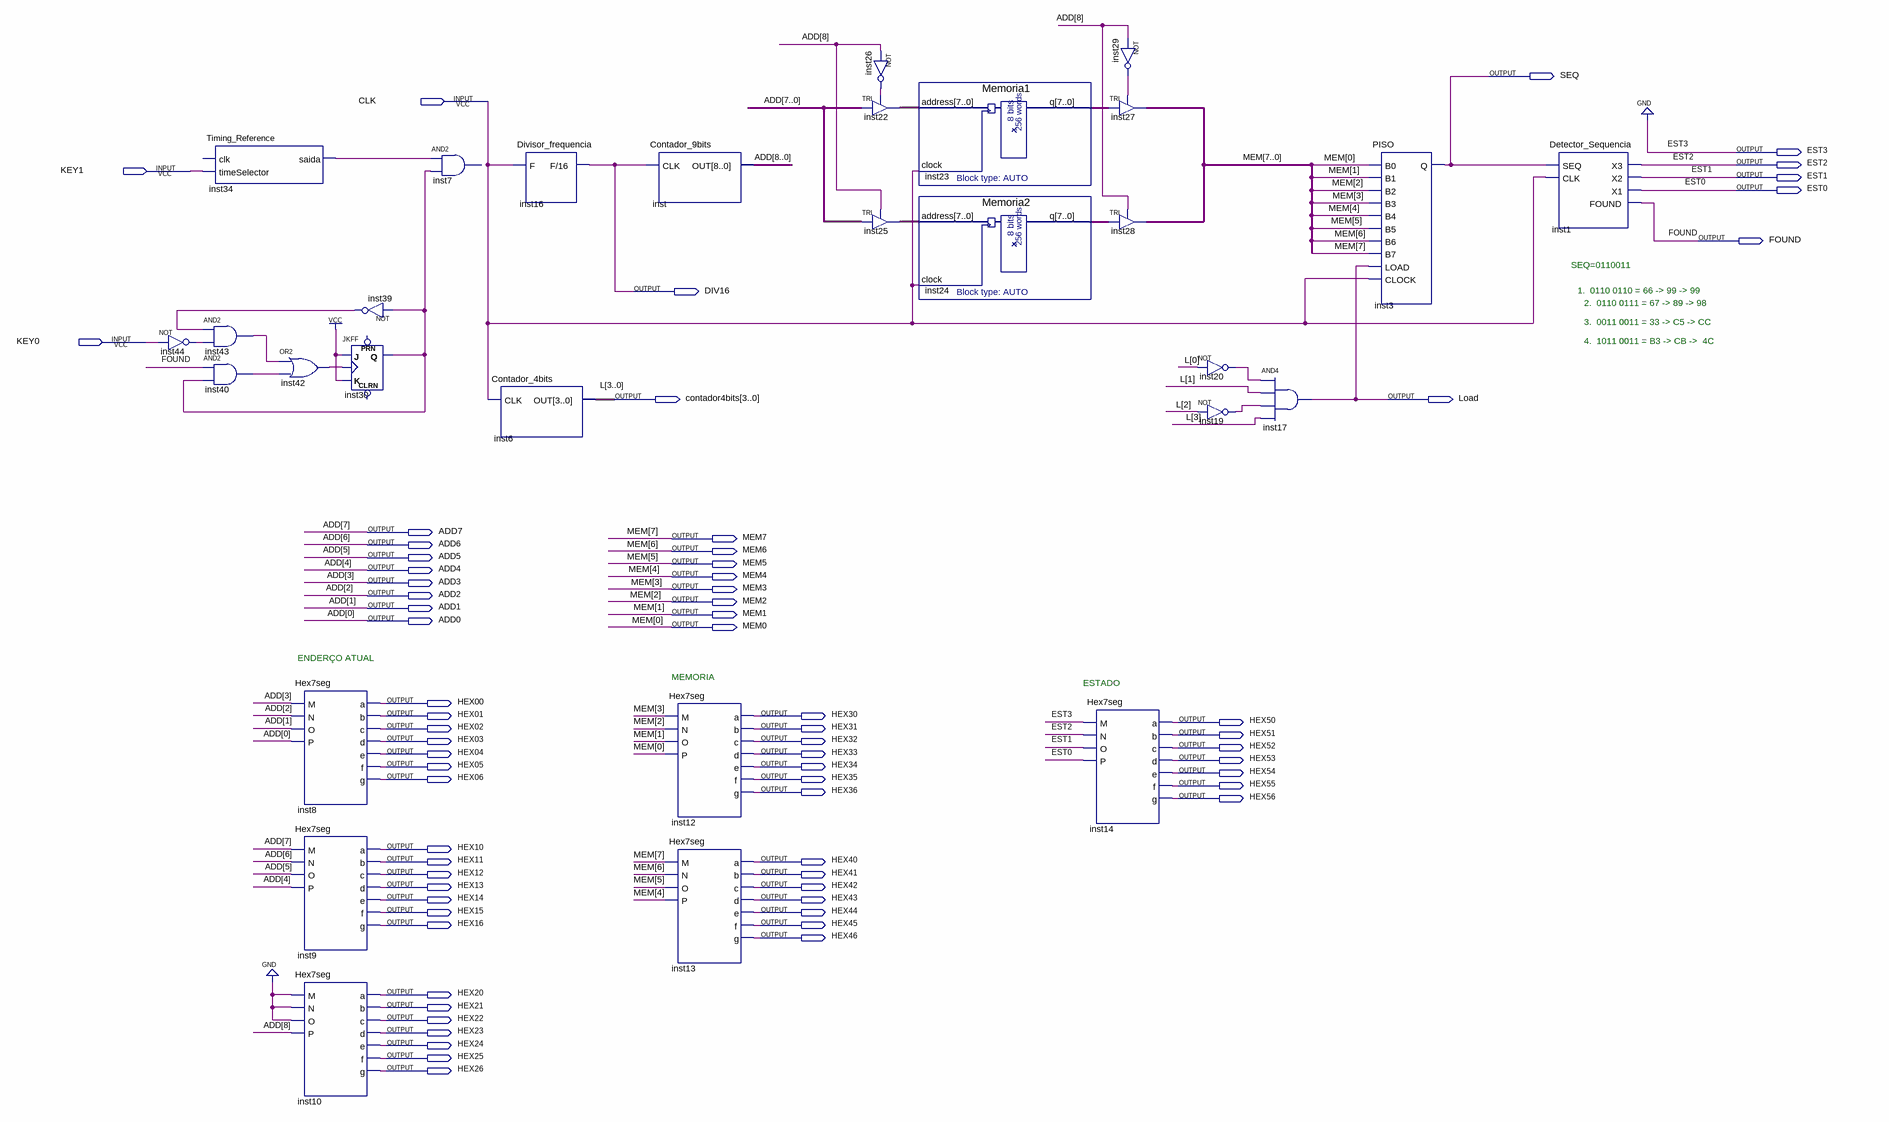
[diagram p0: schematic sheet]
// Quartus schematic Lab7.bdf as structural Verilog: 30 symbols, 70 pins
module Lab7 (
  input  CLK,
  input  KEY1,
  input  KEY0,
  output SEQ,
  output EST3,
  output EST2,
  output EST1,
  output EST0,
  output FOUND,
  output DIV16,
  output [3:0] contador4bits,
  output Load,
  output ADD7,
  output MEM7,
  output ADD6,
  output MEM6,
  output ADD5,
  output MEM5,
  output ADD4,
  output MEM4,
  output ADD3,
  output MEM3,
  output ADD2,
  output MEM2,
  output ADD1,
  output MEM1,
  output ADD0,
  output MEM0,
  output HEX00,
  output HEX01,
  output HEX30,
  output HEX50,
  output HEX02,
  output HEX31,
  output HEX51,
  output HEX03,
  output HEX32,
  output HEX52,
  output HEX04,
  output HEX33,
  output HEX53,
  output HEX05,
  output HEX34,
  output HEX54,
  output HEX06,
  output HEX35,
  output HEX55,
  output HEX36,
  output HEX56,
  output HEX10,
  output HEX11,
  output HEX40,
  output HEX12,
  output HEX41,
  output HEX13,
  output HEX42,
  output HEX14,
  output HEX43,
  output HEX15,
  output HEX44,
  output HEX16,
  output HEX45,
  output HEX46,
  output HEX20,
  output HEX21,
  output HEX22,
  output HEX23,
  output HEX24,
  output HEX25,
  output HEX26
);

  wire inst19_out, inst20_out, inst26_out, inst29_out, inst30_q, inst34_saida, inst39_out, inst40_out,
       inst42_out, inst43_out, inst44_out;
  wire [7:0] inst22_out, inst23_q, inst24_q, inst25_out;
  wire [8:8] ADD;

  not inst44 (inst44_out, KEY0);
  Timing_Reference inst34 (.timeSelector(KEY1), .saida(inst34_saida));  // open: clk
  and inst43 (inst43_out, inst39_out, inst44_out);
  and inst40 (inst40_out, FOUND, inst30_q);
  or inst42 (inst42_out, inst43_out, inst40_out);
  Hex7seg inst8 (
    .M(ADD3), .N(ADD2), .O(ADD1), .P(ADD0), .a(HEX00), .b(HEX01), .c(HEX02), .d(HEX03), .e(HEX04), .f(HEX05),
    .g(HEX06));
  Hex7seg inst9 (
    .M(ADD7), .N(ADD6), .O(ADD5), .P(ADD4), .a(HEX10), .b(HEX11), .c(HEX12), .d(HEX13), .e(HEX14), .f(HEX15),
    .g(HEX16));
  Hex7seg inst10 (
    .M(1'b0), .N(1'b0), .O(1'b0), .P(ADD[8]), .a(HEX20), .b(HEX21), .c(HEX22), .d(HEX23), .e(HEX24),
    .f(HEX25), .g(HEX26));
  JKFF inst30 (.K(1'b1), .J(1'b1), .CLK(inst42_out), .Q(inst30_q));  // open: PRN, CLRN
  not inst39 (inst39_out, inst30_q);
  // AND2 inst7 has open pins: IN1=inst34_saida, IN2=inst30_q, OUT=open
  Contador_4bits inst6 (.CLK(CLK), .OUT(contador4bits));
  Divisor_frequencia inst16 (.F(CLK), .\F/16 (DIV16));
  Contador_9bits inst (.CLK(DIV16), .OUT({ADD[8], ADD7, ADD6, ADD5, ADD4, ADD3, ADD2, ADD1, ADD0}));
  Hex7seg inst12 (
    .M(MEM3), .N(MEM2), .O(MEM1), .P(MEM0), .a(HEX30), .b(HEX31), .c(HEX32), .d(HEX33), .e(HEX34), .f(HEX35),
    .g(HEX36));
  Hex7seg inst13 (
    .M(MEM7), .N(MEM6), .O(MEM5), .P(MEM4), .a(HEX40), .b(HEX41), .c(HEX42), .d(HEX43), .e(HEX44), .f(HEX45),
    .g(HEX46));
  not inst26 (inst26_out, ADD[8]);
  TRI inst22[7:0] (.IN({ADD7, ADD6, ADD5, ADD4, ADD3, ADD2, ADD1, ADD0}), .OE(inst26_out), .OUT(inst22_out));
  TRI inst25[7:0] (.IN({ADD7, ADD6, ADD5, ADD4, ADD3, ADD2, ADD1, ADD0}), .OE(ADD[8]), .OUT(inst25_out));
  Memoria1 inst23 (.address(inst22_out), .clock(CLK), .q(inst23_q));
  Memoria2 inst24 (.address(inst25_out), .clock(CLK), .q(inst24_q));
  Hex7seg inst14 (
    .M(1'b0), .N(EST2), .O(EST1), .P(EST0), .a(HEX50), .b(HEX51), .c(HEX52), .d(HEX53), .e(HEX54), .f(HEX55),
    .g(HEX56));
  not inst29 (inst29_out, ADD[8]);
  TRI inst27[7:0] (.IN(inst23_q), .OE(inst29_out), .OUT({MEM7, MEM6, MEM5, MEM4, MEM3, MEM2, MEM1, MEM0}));
  TRI inst28[7:0] (.IN(inst24_q), .OE(ADD[8]), .OUT({MEM7, MEM6, MEM5, MEM4, MEM3, MEM2, MEM1, MEM0}));
  not inst20 (inst20_out, contador4bits[0]);
  not inst19 (inst19_out, contador4bits[2]);
  and inst17 (Load, inst20_out, contador4bits[1], inst19_out, contador4bits[3]);
  PISO inst3 (
    .B0(MEM0), .B1(MEM1), .B2(MEM2), .B3(MEM3), .B4(MEM4), .B5(MEM5), .B6(MEM6), .B7(MEM7), .LOAD(Load),
    .CLOCK(CLK), .Q(SEQ));
  Detector_Sequencia inst1 (.SEQ(SEQ), .CLK(CLK), .X3(EST2), .X2(EST1), .X1(EST0), .FOUND(FOUND));

  assign EST3 = 1'b0;

  // Other names for the same wires on the sheet: L[3:0] = contador4bits

  // Notes on the sheet:
  //   SEQ=0110011
  //   1.  0110 0110 = 66 -> 99 -> 99
  //   2.  0110 0111 = 67 -> 89 -> 98
  //   3.  0011 0011 = 33 -> C5 -> CC
  //   4.  1011 0011 = B3 -> CB ->  4C
  //   ENDERÇO ATUAL
  //   MEMORIA
  //   ESTADO
endmodule
